# Altium schematic sheet 03_Control.SchDoc: Portable_Guitar_MultiFX
size 420 x 297 mm; Organization: Altium Limited; Address1: L3, 12a Rodborough Rd; Address2: Frenchs Forest; Address3: NSW; Address4: Australia 2086; DocumentNumber: 1; Revision: 1.0; SheetNumber: 4; SheetTotal: 5
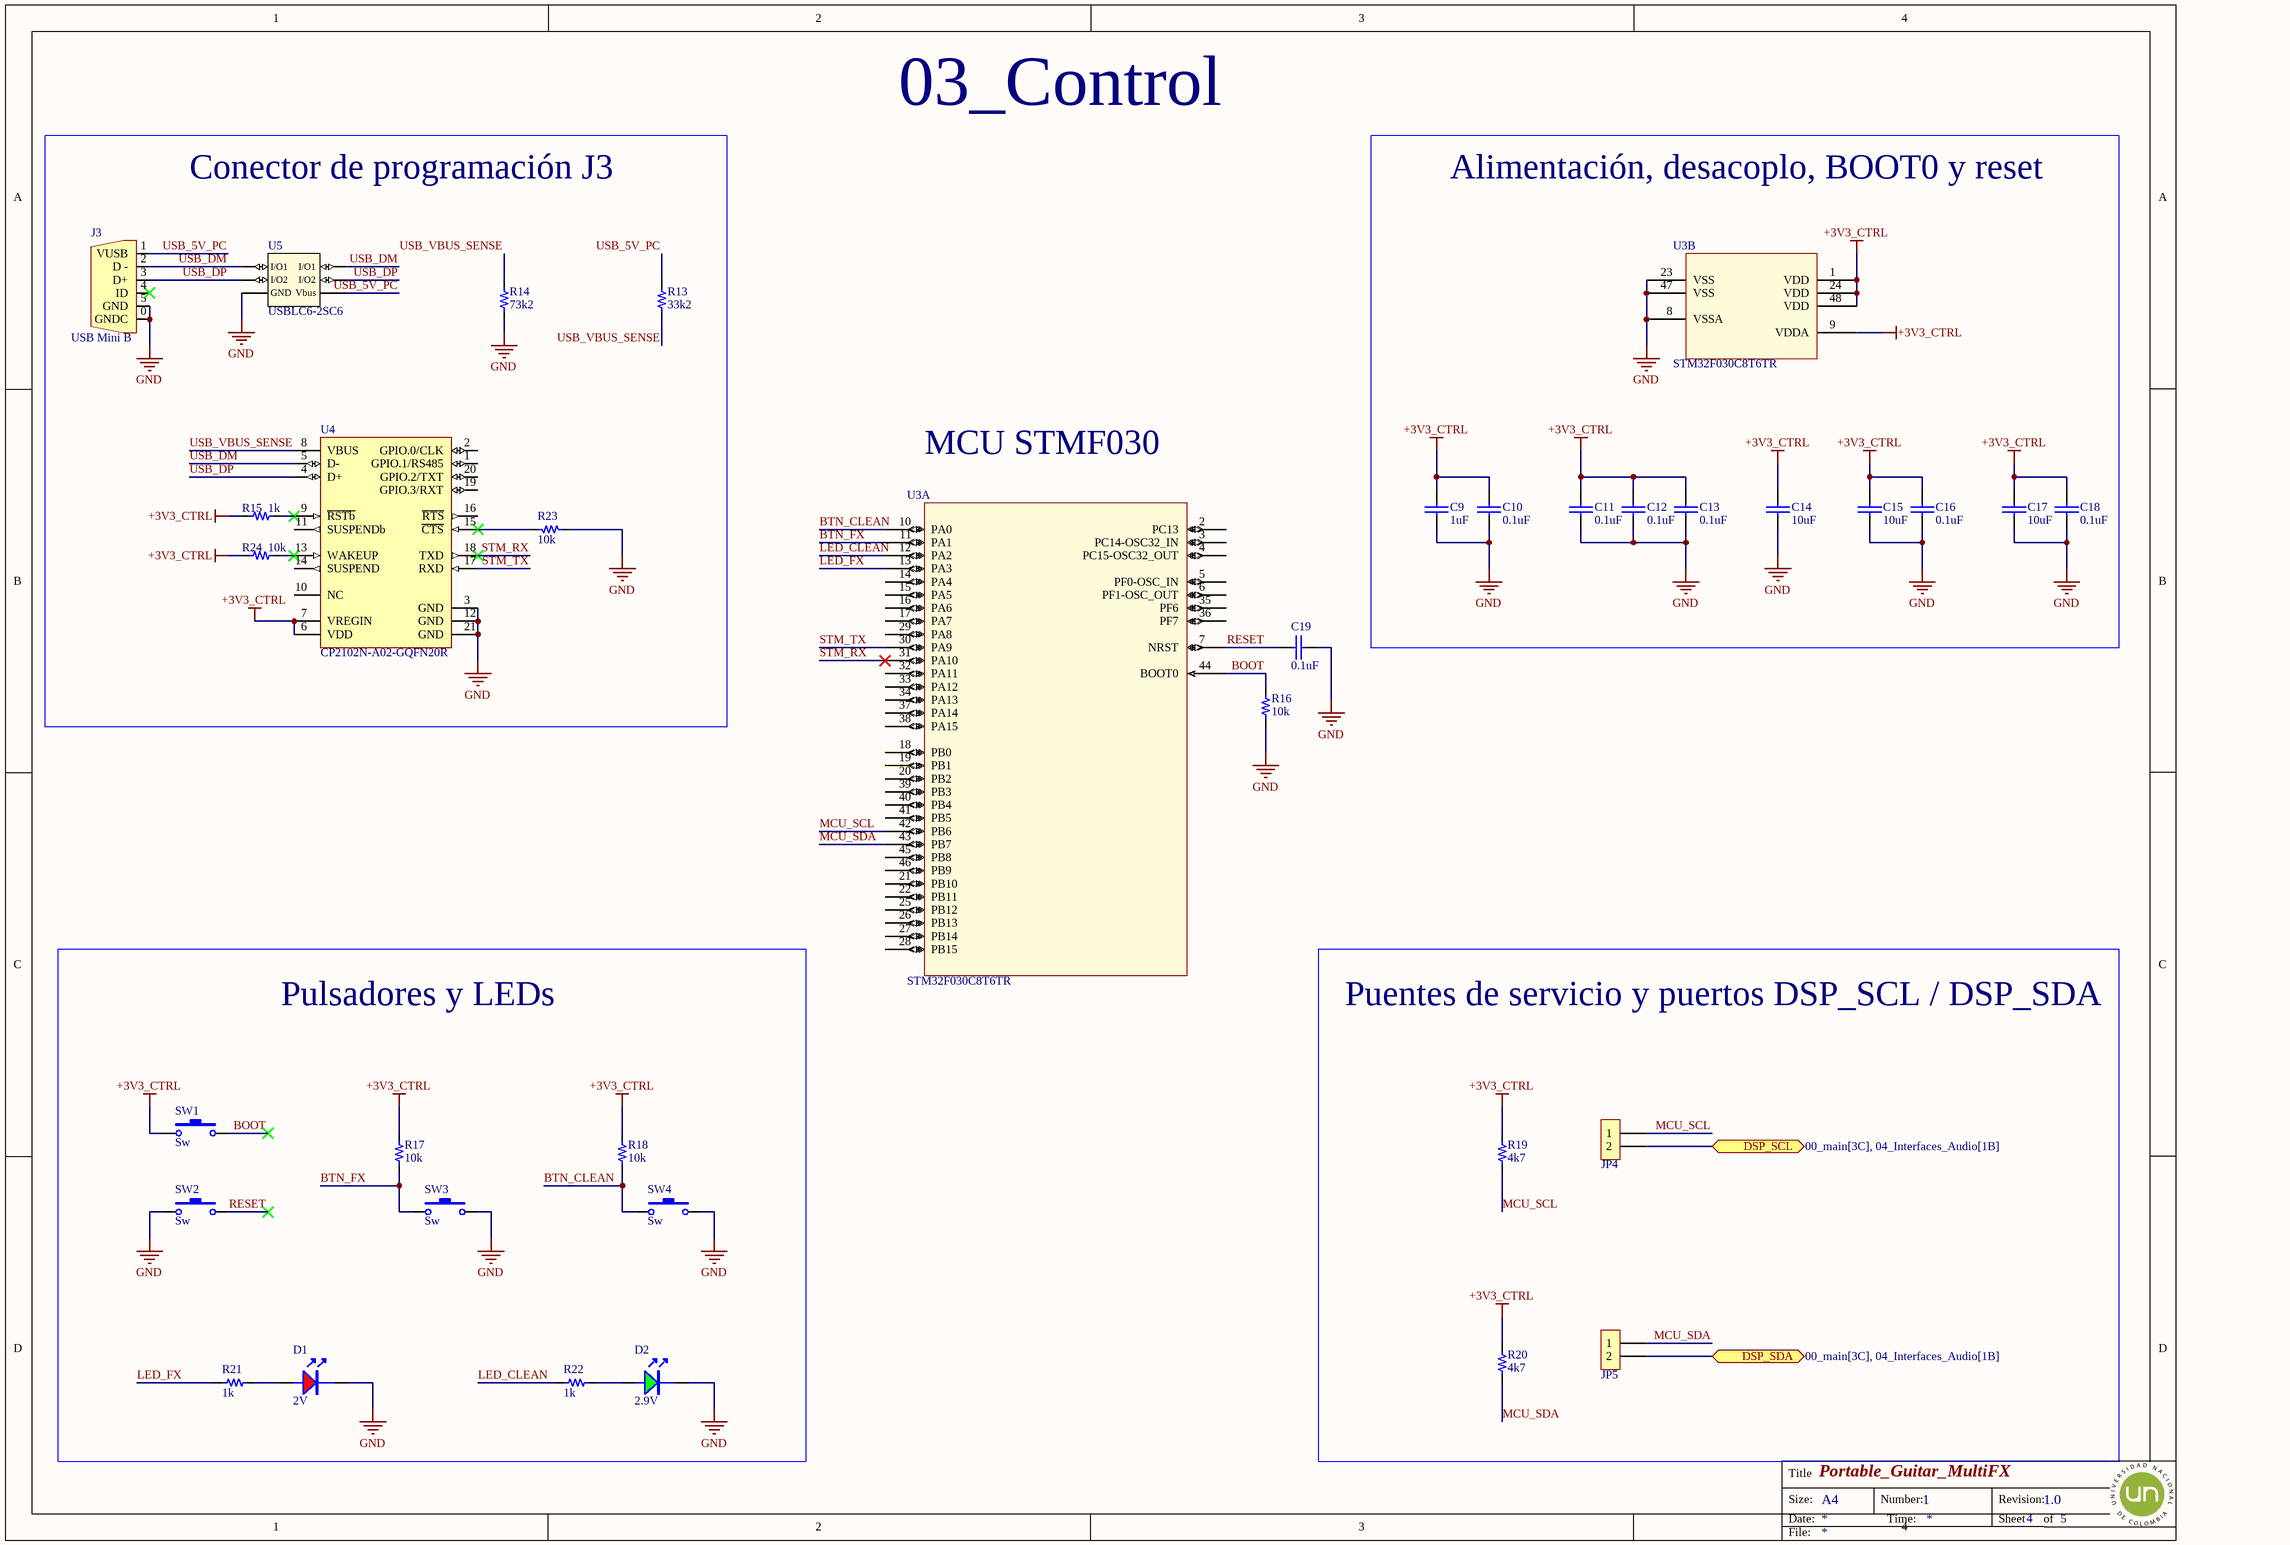
[diagram p0: 03_Control.SchDoc]

## Parts
C9  value 1uF  [0603_cap]  (hidden comment: 1uF 50V)
C10  value 0.1uF  [0603_cap]  (hidden comment: 0.1uF 50V)
C11  value 0.1uF  [0603_cap]  (hidden comment: 0.1uF 50V)
C12  value 0.1uF  [0603_cap]  (hidden comment: 0.1uF 50V)
C13  value 0.1uF  [0603_cap]  (hidden comment: 0.1uF 50V)
C14  value 10uF  [0603_cap]  (hidden comment: 10uF 10V)
C15  value 10uF  [0603_cap]  (hidden comment: 10uF 10V)
C16  value 0.1uF  [0603_cap]  (hidden comment: 0.1uF 50V)
C17  value 10uF  [0603_cap]  (hidden comment: 10uF 10V)
C18  value 0.1uF  [0603_cap]  (hidden comment: 0.1uF 50V)
C19  value 0.1uF  [0603_cap]  (hidden comment: 0.1uF 50V)
D1  2V  [0805_LED]
D2  2.9V  [0805_LED]
J3  USB Mini B  [CON_5x1_SMD_miniUSB_B]
JP4  2x1  [H_2x1_TH_100mil]  (value not drawn)  (no BOM)
JP5  2x1  [H_2x1_TH_100mil]  (value not drawn)  (no BOM)
R13  value 33k2  [0603_res]  (hidden comment: 33k2 1/10W)
R14  value 73k2  [0603_res]  (hidden comment: 73k2 1/10W)
R15  value 1k  [0603_res]  (hidden comment: 1k 1/10W)
R16  value 10k  [0603_res]  (hidden comment: 10k 1/10W)
R17  value 10k  [0603_res]  (hidden comment: 10k 1/10W)
R18  value 10k  [0603_res]  (hidden comment: 10k 1/10W)
R19  value 4k7  [0603_res]  (hidden comment: 4k7 1/10W)
R20  value 4k7  [0603_res]  (hidden comment: 4k7 1/10W)
R21  value 1k  [0603_res]  (hidden comment: 1k 1/10W)
R22  value 1k  [0603_res]  (hidden comment: 1k 1/10W)
R23  value 10k  [0603_res]  (hidden comment: 10k 1/10W)
R24  value 10k  [0603_res]  (hidden comment: 10k 1/10W)
SW1  Sw  [Sw_PUSH_4.5x4.5x5mm]
SW2  Sw  [Sw_PUSH_4.5x4.5x5mm]
SW3  Sw  [Sw_PUSH_4.5x4.5x5mm]
SW4  Sw  [Sw_PUSH_4.5x4.5x5mm]
U3  STM32F030C8T6TR  [LQFP48_7x7mm]  (parts A,B of 2)
U4  CP2102N-A02-GQFN20R  [WFQFN_20_EP_3X3MM]
U5  USBLC6-2SC6  [SOT_23_6]

## Blocks framed on the sheet
Conector de programación J3: J3 R13-R15 R23 R24 U4 U5
Alimentación, desacoplo, BOOT0 y reset: C9-C18 U3
Pulsadores y LEDs: D1 D2 R17 R18 R21 R22 SW1-SW4
Puentes de servicio y puertos DSP_SCL / DSP_SDA: JP4 JP5 R19 R20

## Ports
DSP_SCL (bidir, see 00_main[3C], 04_Interfaces_Audio[1B]), DSP_SDA (bidir, see 00_main[3C], 04_Interfaces_Audio[1B])

## Nets
+3V3_CTRL: C9.1 C10.1 C11.1 C12.2 C13.2 C14.1 C15.1 C16.1 C17.1 C18.1 R15.1 R17.2 R18.2 R19.2 R20.2 R24.1 SW1.1 U3.1(VDD) U3.9(VDDA) U3.24(VDD) U3.48(VDD) U4.6(VDD) U4.7(VREGIN)
GND: C9.2 C10.2 C11.2 C12.1 C13.1 C14.2 C15.2 C16.2 C17.2 C18.2 C19.2 D1.2 D2.2 J3.0(GNDC) J3.5(GND) R14.1 R16.1 R23.1 SW2.1 SW3.2 SW4.2 U3.8(VSSA) U3.23(VSS) U3.47(VSS) U4.3(GND) U4.12(GND) U4.21(GND) U5.2(GND)
BOOT: R16.2 SW1.2 U3.44(BOOT0)
BTN_CLEAN: R18.1 SW4.1 U3.10(PA0)
BTN_FX: R17.1 SW3.1 U3.11(PA1)
DSP_SCL: JP4.2 ; port DSP_SCL
DSP_SDA: JP5.2 ; port DSP_SDA
LED_CLEAN: R22.1 U3.12(PA2)
LED_FX: R21.1 U3.13(PA3)
MCU_SCL: JP4.1 R19.1 U3.42(PB6)
MCU_SDA: JP5.1 R20.1 U3.43(PB7)
RESET: C19.1 SW2.2 U3.7(NRST)
STM_RX: U3.31(PA10) U4.18(TXD)
STM_TX: U3.30(PA9) U4.17(RXD)
USB_5V_PC: J3.1(VUSB) R13.2 U5.5(Vbus)
USB_DM: J3.2(D_-) U4.5(D-) U5.1(I/O1) U5.6(I/O1)
USB_DP: J3.3(D+) U4.4(D+) U5.3(I/O2) U5.4(I/O2)
USB_VBUS_SENSE: R13.1 R14.2 U4.8(VBUS)
NetD1_1: D1.1(A) R21.2
NetD2_1: D2.1(A) R22.2
NetR15_2: R15.2 U4.9(~{RSTb})
NetR23_2: R23.2 U4.15(~{CTS})
NetR24_2: R24.2 U4.13(WAKEUP)

Not connected (* = marked no-connect by the designer): J3 4(ID)*; U3 2(PC13) 3(PC14-OSC32_IN) 4(PC15-OSC32_OUT) 5(PF0-OSC_IN) 6(PF1-OSC_OUT) 14(PA4) 15(PA5) 16(PA6) 17(PA7) 18(PB0) 19(PB1) 20(PB2) 21(PB10) 22(PB11) 25(PB12) 26(PB13) 27(PB14) 28(PB15) 29(PA8) 32(PA11) 33(PA12) 34(PA13) 35(PF6) 36(PF7) 37(PA14) 38(PA15) 39(PB3) 40(PB4) 41(PB5) 45(PB8) 46(PB9); U4 1(GPIO.1/RS485) 2(GPIO.0/CLK) 10(NC) 11(SUSPENDb) 14(SUSPEND) 16(~{RTS}) 19(GPIO.3/RXT) 20(GPIO.2/TXT)

## Notes on the sheet
- 03_Control
- MCU STMF030
- Title
- Size:
- Date:
- File:
- A4
- Number:
- Time:
- Revision:
- Sheet
- of

## Library data of the parts
C9 = Cap_1uF_0603_50V: 50V 1uF X5R ±10% 0603 Multilayer Ceramic Capacitors MLCC - SMD/SMT ROHS; Manufacturer: Samsung Electro-Mechanics; Manufacturer Part Number: CL10A105KB8NNNC; Supplier 1: LCSC; Supplier Part Number 1: C15849; ComponentLink1Description: LCSC; ComponentLink1URL: https://www.lcsc.com/product-detail/Multilayer-Ceramic-Capacitors-MLCC-SMD-SMT_Samsung-Electro-Mechanics-CL10A105KB8NNNC_C15849.html
C10-C13 C16 C18 C19 = Cap_0.1uF_0603_50V: 50V 100nF Y5V -20%~+80% 0603 Multilayer Ceramic Capacitors MLCC - SMD/SMT ROHS; Manufacturer: Walsin Tech Corp; Manufacturer Part Number: 0603F104Z500CT; Supplier 1: LCSC; Supplier Part Number 1: C83060; ComponentLink1Description: LCSC; ComponentLink1URL: https://www.lcsc.com/product-detail/Multilayer-Ceramic-Capacitors-MLCC-SMD-SMT_Walsin-Tech-Corp-0603F104Z500CT_C83060.html
C14 C15 C17 = Cap_10uF_0603_10V: 10V 10uF X5R ±10% 0603 Multilayer Ceramic Capacitors MLCC - SMD/SMT ROHS; Manufacturer: CCTC; Manufacturer Part Number: TCC0603X5R106K100CT; Supplier 1: LCSC; Supplier Part Number 1: C380314; ComponentLink1Description: LCSC; ComponentLink1URL: https://www.lcsc.com/product-detail/Multilayer-Ceramic-Capacitors-MLCC-SMD-SMT_CCTC-TCC0603X5R106K100CT_C380314.html
D1 = LED_0805_RED: LED RED CLEAR 0805 SMD; Manufacturer: XINGLIGHT; Manufacturer Part Number: XL-2012SURC; Supplier 1: LCSC; Supplier Part Number 1: C965812; ComponentLink1Description: LCSC; ComponentLink1URL: https://www.lcsc.com/product-detail/Light-Emitting-Diodes-LED_XINGLIGHT-XL-2012SURC_C965812.html
D2 = LED_0805_Green: LED GREEN CLEAR 0805 SMD; Manufacturer: XINGLIGHT; Manufacturer Part Number: XL-2012UGC; Supplier 1: LCSC; Supplier Part Number 1: C965815; ComponentLink1Description: LCSC; ComponentLink1URL: https://www.lcsc.com/product-detail/Light-Emitting-Diodes-LED_XINGLIGHT-XL-2012UGC_C965815.html
J3 = Con_Mini_USB_B: CONN RCPT USB2.0 MINI B SMD R/A; Manufacturer Part Number: KH-MINI-SMT-5P-Cu; Manufacturer: EDAC Inc.; ComponentLink1Description: LCSC; ComponentLink1URL: https://datasheet.lcsc.com/lcsc/2106070035_Shenzhen-Kinghelm-Elec-KH-MINI-SMT-5P-Cu_C2688795.pdf; Supplier 1: LCSC; Supplier Part Number 1: C2688795
JP4 JP5 = H_Male_2x1_TH_100mil: ComponentLink1Description: LCSC
R13 = Res_33k2_0603_1/10W: 100mW Thick Film Resistor 75V ±100ppm/℃ ±1% 33.2kΩ 0603 Chip Resistor - Surface Mount ROHS; Manufacturer: YAGEO; Manufacturer Part Number: RC0603FR-0733K2L; ComponentLink1URL: https://lcsc.com/product-detail/Chip-Resistor-Surface-Mount_YAGEO-RC0603FR-0733K2L_C185338.html; Supplier 1: LCSC; Supplier Part Number 1: C185338; ComponentLink1Description: LCSC
R14 = Res_73k2_0603_1/10W: 100mW Thick Film Resistor 75V ±100ppm/℃ ±1% 73.2kΩ 0603 Chip Resistor - Surface Mount ROHS; Manufacturer: YAGEO; Manufacturer Part Number: RC0603FR-0773K2L; ComponentLink1URL: https://lcsc.com/product-detail/Chip-Resistor-Surface-Mount_YAGEO-RC0603FR-0773K2L_C163420.html; Supplier 1: LCSC; Supplier Part Number 1: C163420; ComponentLink1Description: LCSC
R15 R21 R22 = Res_1k_0603_1/10W: RES SMD 1k OHM 5% 1/10W 0603; Manufacturer: FOJAN; Manufacturer Part Number: FRC0603J102 TS; ComponentLink1URL: https://www.lcsc.com/product-detail/Chip-Resistor-Surface-Mount_FOJAN-FRC0603J102-TS_C2907113.html; Supplier 1: LCSC; Supplier Part Number 1: C2907113; ComponentLink1Description: LCSC
R16-R18 R23 R24 = Res_10k_0603_1/10W: RES SMD 10k OHM 5% 1/10W 0603; Manufacturer: FOJAN; Manufacturer Part Number: FRC0603J103TS; ComponentLink1URL: https://www.lcsc.com/product-detail/Chip-Resistor-Surface-Mount_FOJAN-FRC0603J103TS_C2930027.html; Supplier 1: LCSC; Supplier Part Number 1: C2930027; ComponentLink1Description: LCSC
R19 R20 = Res_4k7_0603_1/10W: 100mW Thick Film Resistor 75V ±1% 4.7kΩ 0603 Chip Resistor - Surface Mount ROHS; Manufacturer: VO; Manufacturer Part Number: SCR0603F4K7; ComponentLink1URL: https://lcsc.com/product-detail/Chip-Resistor-Surface-Mount_VO-SCR0603F4K7_C3016318.html; Supplier 1: LCSC; Supplier Part Number 1: C3016318; ComponentLink1Description: LCSC
SW1-SW4 = Sw_PUSH_4.5x4.5x5.0xmm: SWITCH TACTILE SPST-NO 0.05A 12V; Manufacturer: BZCN; Manufacturer Part Number: TSC015A05026A; Supplier 1: LCSC; Supplier Part Number 1: C2888509; Last modified by: N-A.Potosi; Last modified date: 20190222; ComponentLink1Description: LCSC; ComponentLink1URL: https://www.lcsc.com/product-detail/Tactile-Switches_BZCN-TSC015A05026A_C2888509.html
U3 = IC_STM32F030C8T6TR_LQFP48_7x7MM: IC MCU 32BIT 64KB FLASH 48LQFP; Manufacturer: STMicroelectronics; Manufacturer part number: STM32F030C8T6TR; Supplier 1: LCSC; Supplier Part Number 1: C23922; ComponentLink1Description: LCSC; ComponentLink1URL: https://www.lcsc.com/product-detail/ST-Microelectronics_STMicroelectronics-STM32F030C8T6_C23922.html
U4 = IC_SGL_USB2UART-BRIDGE_20QFN: IC USB TO UART BRIDGE QFN20; Manufacturer: Silicon Labs; Manufacturer Part Number: CP2102N-A02-GQFN20R; Supplier 1: LCSC; Supplier Part Number 1: C969913; ComponentLink1Description: LCSC; ComponentLink1URL: https://www.lcsc.com/product-detail/USB-ICs_SILICON-LABS-CP2102N-A02-GQFN20R_C969913.html
U5 = TVS_5.25V_2CH_SOT_23_6: TVS DIODE 5.25V 17V SOT23-6; Manufacturer: STMicroelectronics; ComponentLink1Description: LCSC; ComponentLink1URL: https://www.lcsc.com/product-detail/ESD-Protection-Devices_STMicroelectronics-USBLC6-2SC6_C7519.html; Supplier 1: LCSC; Manufacturer Part Number: USBLC6-2SC6; Supplier Part Number 1: C7519